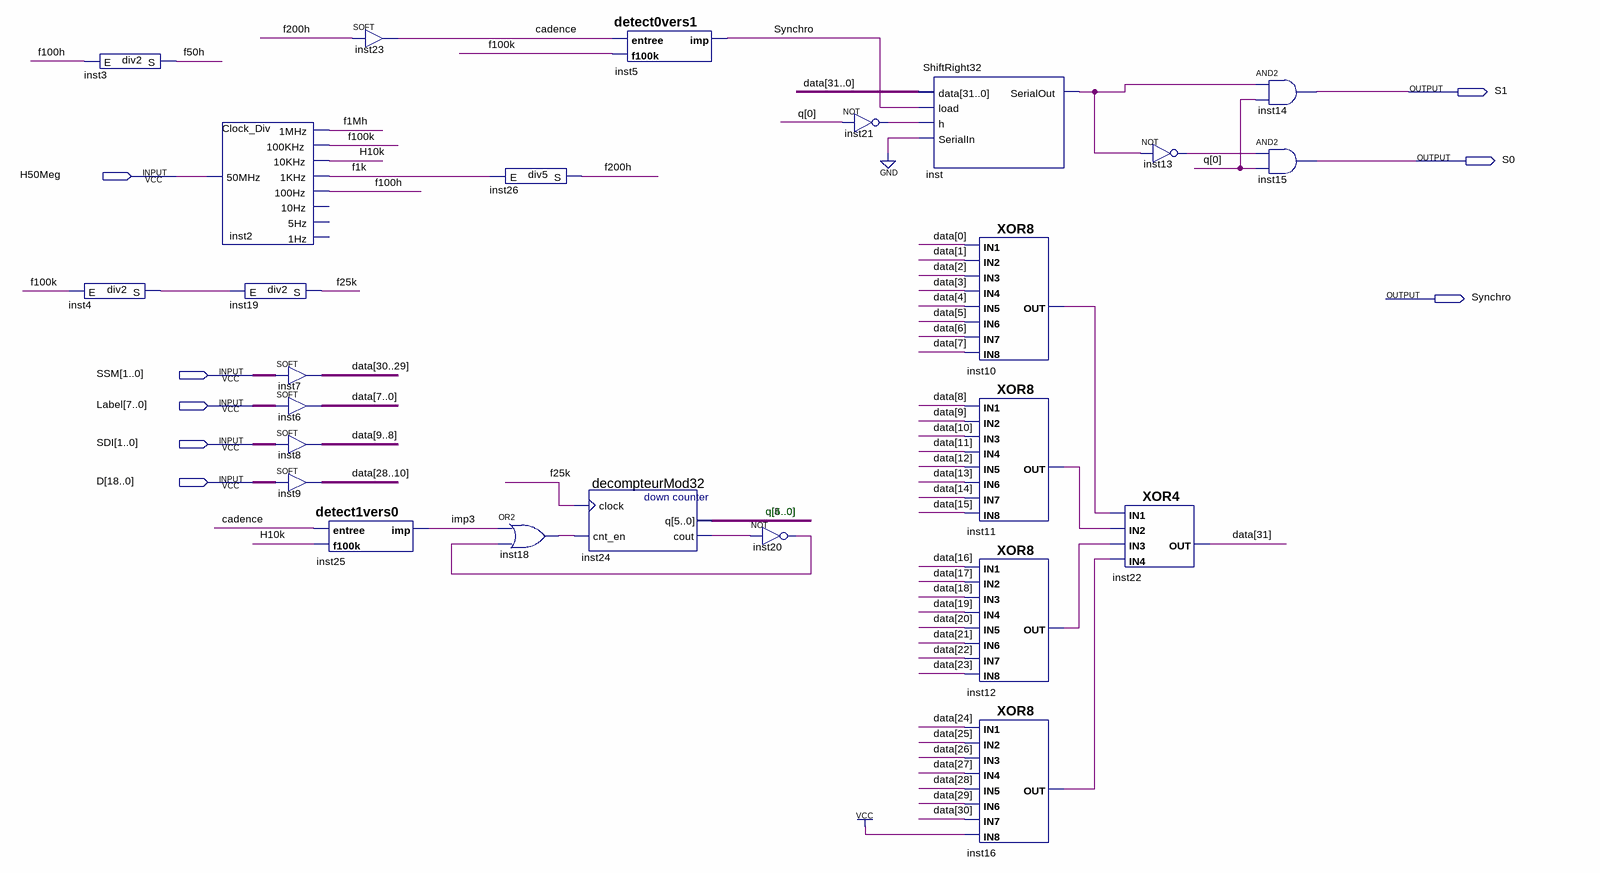
[diagram p0: schematic sheet]
// Quartus schematic GenerateurArinc.bdf as structural Verilog: 25 symbols, 8 pins
module GenerateurArinc (
  input  H50Meg,
  input  [1:0] SSM,
  input  [7:0] Label,
  input  [1:0] SDI,
  input  [18:0] D,
  output S1,
  output S0,
  output Synchro
);

  wire cadence, f1k, f1Mh, f25k, f50h, f100h, f100k, f200h, H10k, imp3, inst4_s, inst10_out, inst11_out,
       inst12_out, inst13_out, inst16_out, inst18_out, inst20_out, inst21_out, inst24_cout, inst_serialout;
  wire [5:0] q;
  wire [31:0] data;

  div2 inst3 (.E(f100h), .S(f50h));
  div2 inst4 (.E(f100k), .S(inst4_s));
  Clock_Div inst2 (
    .\50MHz (H50Meg), .\1MHz (f1Mh), .\100KHz (f100k), .\10KHz (H10k), .\1KHz (f1k), .\100Hz (f100h));  // open: 10Hz, 5Hz, 1Hz
  div2 inst19 (.E(inst4_s), .S(f25k));
  SOFT inst7[1:0] (.IN(SSM), .OUT(data[30:29]));
  SOFT inst6[7:0] (.IN(Label), .OUT(data[7:0]));
  SOFT inst8[1:0] (.IN(SDI), .OUT(data[9:8]));
  SOFT inst9[18:0] (.IN(D), .OUT(data[28:10]));
  SOFT inst23 (.IN(f200h), .OUT(cadence));
  detect1vers0 inst25 (.entree(cadence), .f100k(H10k), .imp(imp3));
  div5 inst26 (.E(f1k), .S(f200h));
  or inst18 (inst18_out, imp3, inst20_out);
  decompteurMod32 inst24 (.clock(f25k), .cnt_en(inst18_out), .q(q), .cout(inst24_cout));
  detect0vers1 inst5 (.entree(cadence), .f100k(f100k), .imp(Synchro));
  not inst20 (inst20_out, inst24_cout);
  not inst21 (inst21_out, q[0]);
  ShiftRight32 inst (.data(data), .load(Synchro), .h(inst21_out), .SerialIn(1'b0), .SerialOut(inst_serialout));
  XOR8 inst10 (
    .IN8(data[7]), .IN1(data[0]), .IN7(data[6]), .IN6(data[5]), .IN5(data[4]), .IN4(data[3]), .IN3(data[2]),
    .IN2(data[1]), .OUT(inst10_out));
  XOR8 inst11 (
    .IN8(data[15]), .IN1(data[8]), .IN7(data[14]), .IN6(data[13]), .IN5(data[12]), .IN4(data[11]),
    .IN3(data[10]), .IN2(data[9]), .OUT(inst11_out));
  XOR8 inst12 (
    .IN8(data[23]), .IN1(data[16]), .IN7(data[22]), .IN6(data[21]), .IN5(data[20]), .IN4(data[19]),
    .IN3(data[18]), .IN2(data[17]), .OUT(inst12_out));
  XOR8 inst16 (
    .IN8(1'b1), .IN1(data[24]), .IN7(data[30]), .IN6(data[29]), .IN5(data[28]), .IN4(data[27]),
    .IN3(data[26]), .IN2(data[25]), .OUT(inst16_out));
  not inst13 (inst13_out, inst_serialout);
  XOR4 inst22 (.IN3(inst12_out), .IN4(inst16_out), .IN2(inst11_out), .IN1(inst10_out), .OUT(data[31]));
  and inst14 (S1, inst_serialout, q[0]);
  and inst15 (S0, inst13_out, q[0]);

  // Notes on the sheet:
  //   q[4..0]
endmodule
